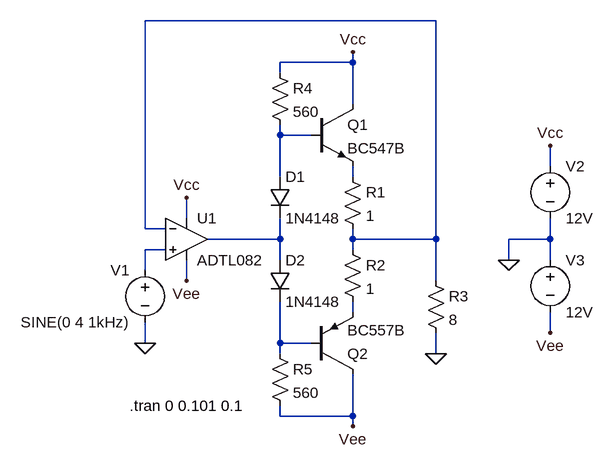
[diagram p0: schematic ClaseB_Completo_BJT.asc]
ClaseB_Completo_BJT.asc, the LTspice schematic file:
Version 4.1
SHEET 1 880 680
WIRE 416 -96 -32 -96
WIRE 288 -32 288 -48
WIRE 288 -32 176 -32
WIRE 176 -16 176 -32
WIRE 288 32 288 -32
WIRE 176 80 176 64
WIRE 224 80 176 80
WIRE 592 128 592 96
WIRE 176 144 176 80
WIRE 288 144 288 128
WIRE 32 208 32 176
WIRE -32 224 -32 -96
WIRE 0 224 -32 224
WIRE 176 240 176 208
WIRE 176 240 64 240
WIRE 288 240 288 224
WIRE 416 240 416 -96
WIRE 416 240 288 240
WIRE 592 240 592 208
WIRE 592 240 528 240
WIRE 0 256 -32 256
WIRE 288 256 288 240
WIRE 176 272 176 240
WIRE 528 272 528 240
WIRE 592 272 592 240
WIRE -32 288 -32 256
WIRE 32 304 32 272
WIRE 416 304 416 240
WIRE 288 352 288 336
WIRE 592 384 592 352
WIRE -32 400 -32 368
WIRE 176 400 176 336
WIRE 224 400 176 400
WIRE 176 416 176 400
WIRE 416 416 416 384
WIRE 176 512 176 496
WIRE 288 512 288 448
WIRE 288 512 176 512
WIRE 288 528 288 512
FLAG 288 -48 Vcc
FLAG 288 528 Vee
FLAG 416 416 0
FLAG 32 176 Vcc
FLAG 32 304 Vee
FLAG -32 400 0
FLAG 528 272 0
FLAG 592 96 Vcc
FLAG 592 384 Vee
SYMBOL npn 224 32 R0
SYMATTR InstName Q1
SYMATTR Value BC547B
SYMBOL pnp 224 448 M180
SYMATTR InstName Q2
SYMATTR Value BC557B
SYMBOL res 272 128 R0
SYMATTR InstName R1
SYMATTR Value 1
SYMBOL res 272 240 R0
SYMATTR InstName R2
SYMATTR Value 1
SYMBOL res 400 288 R0
SYMATTR InstName R3
SYMATTR Value 8
SYMBOL diode 160 144 R0
SYMATTR InstName D1
SYMATTR Value 1N4148
SYMBOL diode 160 272 R0
SYMATTR InstName D2
SYMATTR Value 1N4148
SYMBOL res 160 -32 R0
SYMATTR InstName R4
SYMATTR Value 560
SYMBOL res 160 400 R0
SYMATTR InstName R5
SYMATTR Value 560
SYMBOL OpAmps\\ADTL082 32 176 R0
SYMATTR InstName U1
SYMBOL voltage -32 272 M0
WINDOW 123 0 0 Left 0
WINDOW 39 0 0 Left 0
SYMATTR InstName V1
SYMATTR Value SINE(0 4 1kHz)
SYMBOL voltage 592 112 R0
WINDOW 123 0 0 Left 0
WINDOW 39 0 0 Left 0
SYMATTR InstName V2
SYMATTR Value 12V
SYMBOL voltage 592 256 R0
WINDOW 123 0 0 Left 0
WINDOW 39 0 0 Left 0
SYMATTR InstName V3
SYMATTR Value 12V
TEXT -56 496 Left 2 !.tran 0 0.101 0.1

The netlist it stands for:
* ClaseB_Completo_BJT.asc
Q1 Vcc N002 N003 0 BC547B
Q2 Vee N007 N006 0 BC557B
R1 N003 N001 1
R2 N001 N006 1
R3 N001 0 8
D1 N002 N004 1N4148
D2 N004 N007 1N4148
R4 Vcc N002 560
R5 N007 Vee 560
X§U1 N005 N001 Vcc Vee N004 ADTL082  ; pins In+ In- V+ V- OUT
V1 N005 0 SINE(0 4 1kHz)
V2 Vcc 0 12V
V3 0 Vee 12V
.model D D
.lib standard.dio
.model NPN NPN
.model PNP PNP
.lib standard.bjt
.tran 0 0.101 0.1
.lib ADI.lib
.backanno
.end